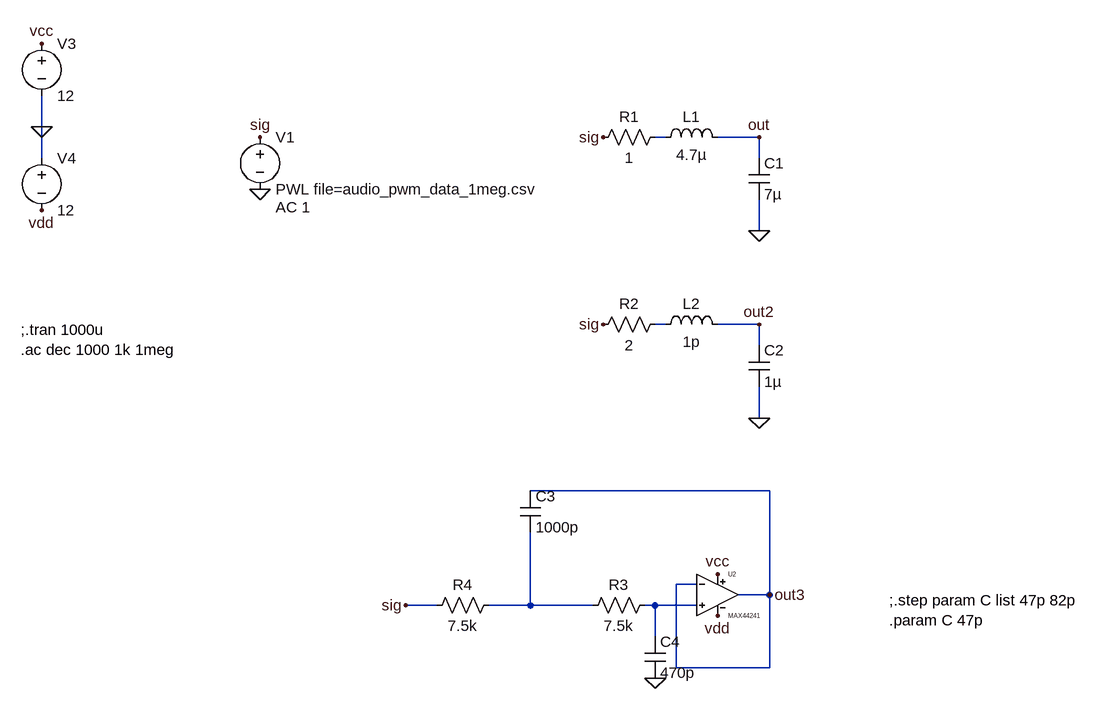
[diagram p0: schematic audio_pwm.asc]
audio_pwm.asc, the LTspice schematic file:
Version 4
SHEET 1 1492 952
WIRE -352 64 -352 16
WIRE 608 80 592 80
WIRE 752 80 688 80
WIRE -352 112 -352 64
WIRE 752 112 752 80
WIRE 752 224 752 176
WIRE 608 368 592 368
WIRE 752 368 688 368
WIRE 752 400 752 368
WIRE 752 512 752 464
WIRE 768 624 400 624
WIRE 656 768 624 768
WIRE 768 784 768 624
WIRE 768 784 720 784
WIRE 256 800 208 800
WIRE 400 800 400 688
WIRE 400 800 336 800
WIRE 496 800 400 800
WIRE 592 800 576 800
WIRE 656 800 592 800
WIRE 592 848 592 800
WIRE 624 896 624 768
WIRE 768 896 768 784
WIRE 768 896 624 896
FLAG -16 160 0
FLAG -352 -64 vcc
FLAG -352 192 vdd
FLAG -352 64 0
FLAG -16 80 sig
FLAG 752 224 0
FLAG 512 80 sig
FLAG 752 80 out
FLAG 752 512 0
FLAG 512 368 sig
FLAG 752 368 out2
FLAG 688 816 vdd
FLAG 688 752 vcc
FLAG 768 784 out3
FLAG 592 912 0
FLAG 208 800 sig
SYMBOL voltage -16 64 R0
WINDOW 123 24 124 Left 2
WINDOW 39 0 0 Left 0
SYMATTR Value2 AC 1
SYMATTR InstName V1
SYMATTR Value PWL file=audio_pwm_data_1meg.csv
SYMBOL voltage -352 -80 R0
WINDOW 123 0 0 Left 0
WINDOW 39 0 0 Left 0
SYMATTR InstName V3
SYMATTR Value 12
SYMBOL voltage -352 96 R0
WINDOW 123 0 0 Left 0
WINDOW 39 0 0 Left 0
SYMATTR InstName V4
SYMATTR Value 12
SYMBOL ind 592 96 R270
WINDOW 0 32 56 VTop 2
WINDOW 3 5 56 VBottom 2
SYMATTR InstName L1
SYMATTR Value 4.7µ
SYMBOL cap 736 112 R0
SYMATTR InstName C1
SYMATTR Value 7µ
SYMBOL res 608 64 R90
WINDOW 0 0 56 VBottom 2
WINDOW 3 32 56 VTop 2
SYMATTR InstName R1
SYMATTR Value 1
SYMBOL ind 592 384 R270
WINDOW 0 32 56 VTop 2
WINDOW 3 5 56 VBottom 2
SYMATTR InstName L2
SYMATTR Value 1p
SYMBOL cap 736 400 R0
SYMATTR InstName C2
SYMATTR Value 1µ
SYMBOL res 608 352 R90
WINDOW 0 0 56 VBottom 2
WINDOW 3 32 56 VTop 2
SYMATTR InstName R2
SYMATTR Value 2
SYMBOL res 592 784 R90
WINDOW 0 0 56 VBottom 2
WINDOW 3 32 56 VTop 2
SYMATTR InstName R3
SYMATTR Value 7.5k
SYMBOL res 352 784 R90
WINDOW 0 0 56 VBottom 2
WINDOW 3 32 56 VTop 2
SYMATTR InstName R4
SYMATTR Value 7.5k
SYMBOL cap 384 624 R0
SYMATTR InstName C3
SYMATTR Value 1000p
SYMBOL cap 576 848 R0
SYMATTR InstName C4
SYMATTR Value 470p
SYMBOL MAX44241 688 720 R0
SYMATTR InstName U2
TEXT -384 376 Left 2 !;.tran 1000u\n.ac dec 1000 1k 1meg
TEXT 952 792 Left 2 !;.step param C list 47p 82p\n.param C 47p

The netlist it stands for:
* audio_pwm.asc
V1 sig 0 PWL file=audio_pwm_data_1meg.csv AC 1
V3 vcc 0 12
V4 0 vdd 12
L1 N001 out 4.7µ
C1 out 0 7µ
R1 N001 sig 1
L2 N002 out2 1p
C2 out2 0 1µ
R2 N002 sig 2
R3 N004 N003 7.5k
R4 N003 sig 7.5k
C3 out3 N003 1000p
C4 N004 0 470p
XU2 N004 out3 vcc vdd out3 MAX44241  ; pins INA+ INA- VDD VSS OUTA
;.tran 1000u
.ac dec 1000 1k 1meg
;.step param C list 47p 82p
.param C 47p
.lib MAX44241.lib
.backanno
.end